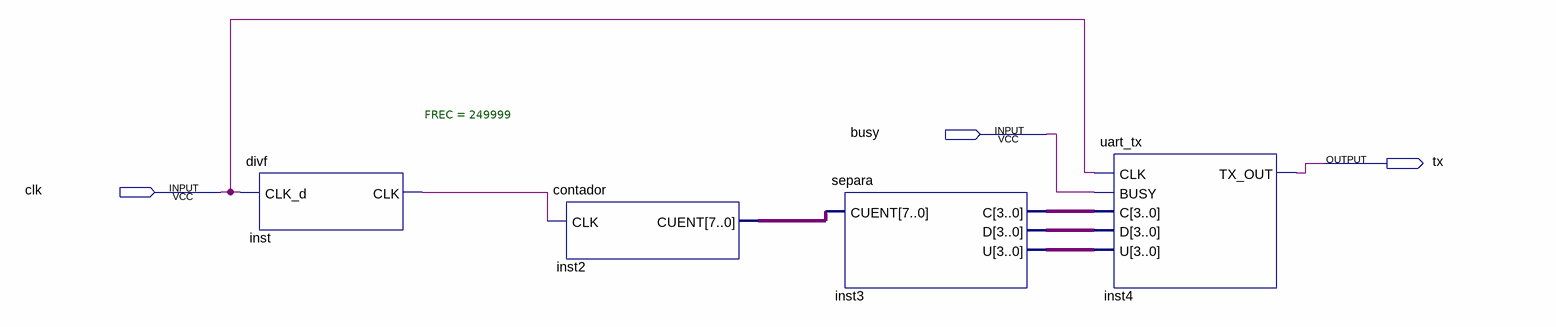
[diagram p0: schematic sheet]
// Quartus schematic prueba.bdf as structural Verilog: 4 symbols, 3 pins
module prueba (
  input  busy,
  input  clk,
  output tx
);

  wire inst_clk;
  wire [3:0] inst3_c, inst3_d, inst3_u;
  wire [7:0] inst2_cuent;

  divf #(.FREC(249999)) inst (.CLK_d(clk), .CLK(inst_clk));
  contador inst2 (.CLK(inst_clk), .CUENT(inst2_cuent));
  separa inst3 (.CUENT(inst2_cuent), .C(inst3_c), .D(inst3_d), .U(inst3_u));
  uart_tx inst4 (.CLK(clk), .BUSY(busy), .C(inst3_c), .D(inst3_d), .U(inst3_u), .TX_OUT(tx));
endmodule
